# Altium schematic sheet Mezzaine_connector.SchDoc: =DocumentName
size A4; DocumentNumber: 1; Revision: 0; SheetNumber: 6; SheetTotal: 6
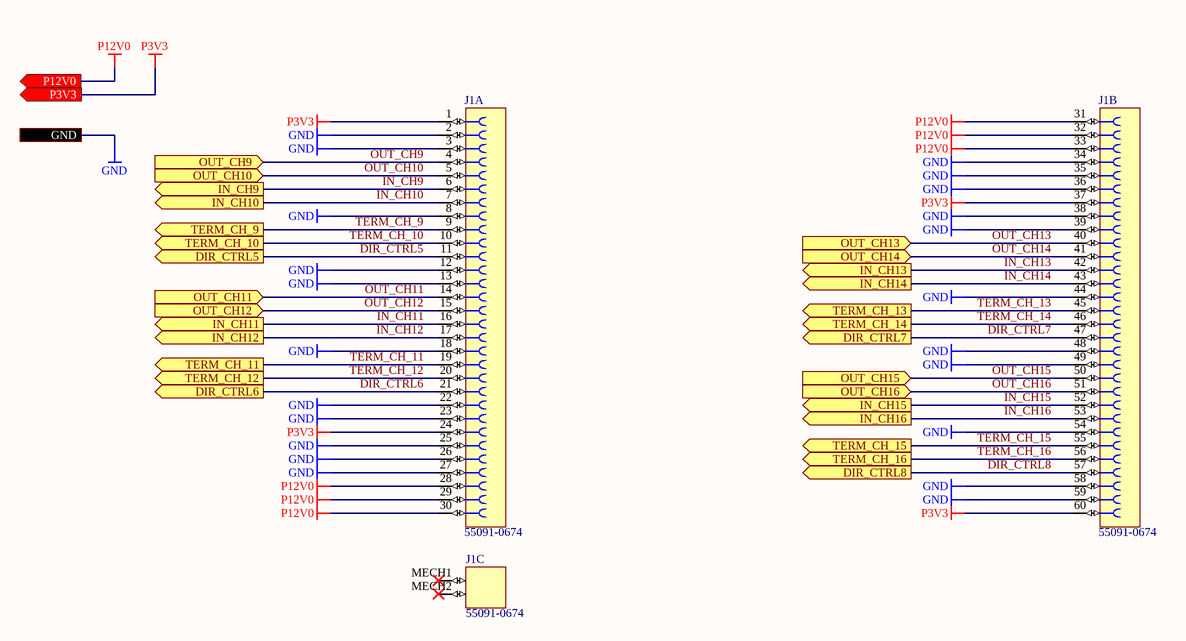
[diagram p0: Mezzaine_connector.SchDoc]

## Parts
J1  55091-0674  [55091-0674]  (parts A,B,C of 3)

## Ports
DIR_CTRL5 (out), DIR_CTRL6 (out), DIR_CTRL7 (out), DIR_CTRL8 (out), GND, IN_CH9 (out), IN_CH10 (out), IN_CH11 (out), IN_CH12 (out), IN_CH13 (out), IN_CH14 (out), IN_CH15 (out), IN_CH16 (out), OUT_CH9 (in), OUT_CH10 (in), OUT_CH11 (in), OUT_CH12 (in), OUT_CH13 (in), OUT_CH14 (in), OUT_CH15 (in), OUT_CH16 (in), P3V3 (out), P12V0 (out), TERM_CH_9 (out), TERM_CH_10 (out), TERM_CH_11 (out), TERM_CH_12 (out), TERM_CH_13 (out), TERM_CH_14 (out), TERM_CH_15 (out), TERM_CH_16 (out)

## Nets
GND: J1.2 J1.3 J1.8 J1.12 J1.13 J1.18 J1.22 J1.23 J1.25 J1.26 J1.27 J1.34 J1.35 J1.36 J1.38 J1.39 J1.44 J1.48 J1.49 J1.54 J1.58 J1.59 ; port GND
P3V3: J1.1 J1.24 J1.37 J1.60 ; port P3V3
P12V0: J1.28 J1.29 J1.30 J1.31 J1.32 J1.33 ; port P12V0
DIR_CTRL5: J1.11 ; port DIR_CTRL5
DIR_CTRL6: J1.21 ; port DIR_CTRL6
DIR_CTRL7: J1.47 ; port DIR_CTRL7
DIR_CTRL8: J1.57 ; port DIR_CTRL8
IN_CH9: J1.6 ; port IN_CH9
IN_CH10: J1.7 ; port IN_CH10
IN_CH11: J1.16 ; port IN_CH11
IN_CH12: J1.17 ; port IN_CH12
IN_CH13: J1.42 ; port IN_CH13
IN_CH14: J1.43 ; port IN_CH14
IN_CH15: J1.52 ; port IN_CH15
IN_CH16: J1.53 ; port IN_CH16
OUT_CH9: J1.4 ; port OUT_CH9
OUT_CH10: J1.5 ; port OUT_CH10
OUT_CH11: J1.14 ; port OUT_CH11
OUT_CH12: J1.15 ; port OUT_CH12
OUT_CH13: J1.40 ; port OUT_CH13
OUT_CH14: J1.41 ; port OUT_CH14
OUT_CH15: J1.50 ; port OUT_CH15
OUT_CH16: J1.51 ; port OUT_CH16
TERM_CH_9: J1.9 ; port TERM_CH_9
TERM_CH_10: J1.10 ; port TERM_CH_10
TERM_CH_11: J1.19 ; port TERM_CH_11
TERM_CH_12: J1.20 ; port TERM_CH_12
TERM_CH_13: J1.45 ; port TERM_CH_13
TERM_CH_14: J1.46 ; port TERM_CH_14
TERM_CH_15: J1.55 ; port TERM_CH_15
TERM_CH_16: J1.56 ; port TERM_CH_16

Not connected (* = marked no-connect by the designer): J1 MECH1* MECH2*

## Notes on the sheet
- Release
- Last modified =ModifiedDate
  Sheet =sheetnumber of =sheettotal · Size A4
- Copyright =P_copyright_owner
  This source describes Open Hardware and is licensed under the CERN-OHL-W v2. You may redistribute and modify this source and make products using it under the terms of the CERN-OHL-W v2 (https://cern.ch/cern-ohl). This source is distributed WITHOUT ANY EXPRESS OR IMPLIED WARRANTY, INCLUDING OF MERCHANTABILITY, SATISFACTORY QUALITY AND FITNESS FOR A PARTICULAR PURPOSE. Please see the CERN-OHL-W v2 for applicable conditions.
  Notice: If You produce hardware based on this source, You must maintain the Source Location visible on the product, its packaging or its documentation.
- SINARA OPEN HARDWARE
- OPEN HARDWARE FOR SCIENTIFIC INSTRUMENTATION
- https://github.com/sinara-hw
- Release owner
- Designers
- Reviewers
- Source location:

## Library data of the parts
J1 = CMP-002-04666-1: Header Connector, PCB Mount, RECEPT, 60 Contacts, PIN, 0.025 Pitch, SURFACE MOUNT Term; Manufacturer: Molex; Manufacturer Part Number: 0550910674; Mounting Technology: Surface Mount; Max Operating Temperature: 85°C; Pins: 60; Number of Rows: 2; Case/Package: Metal; Min Operating Temperature: -55°C